# EAGLE schematic Adafruit Metro ESP32-P4 Hydra rev A (EAGLE 9.6.2)

## Sheet 1 of 2
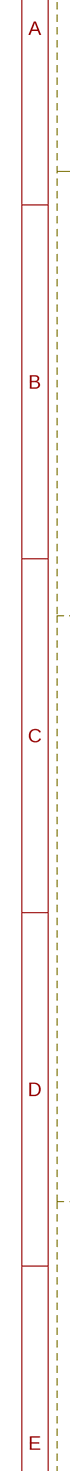
[diagram p0: schematic, sheet 1, part 1 of 2]
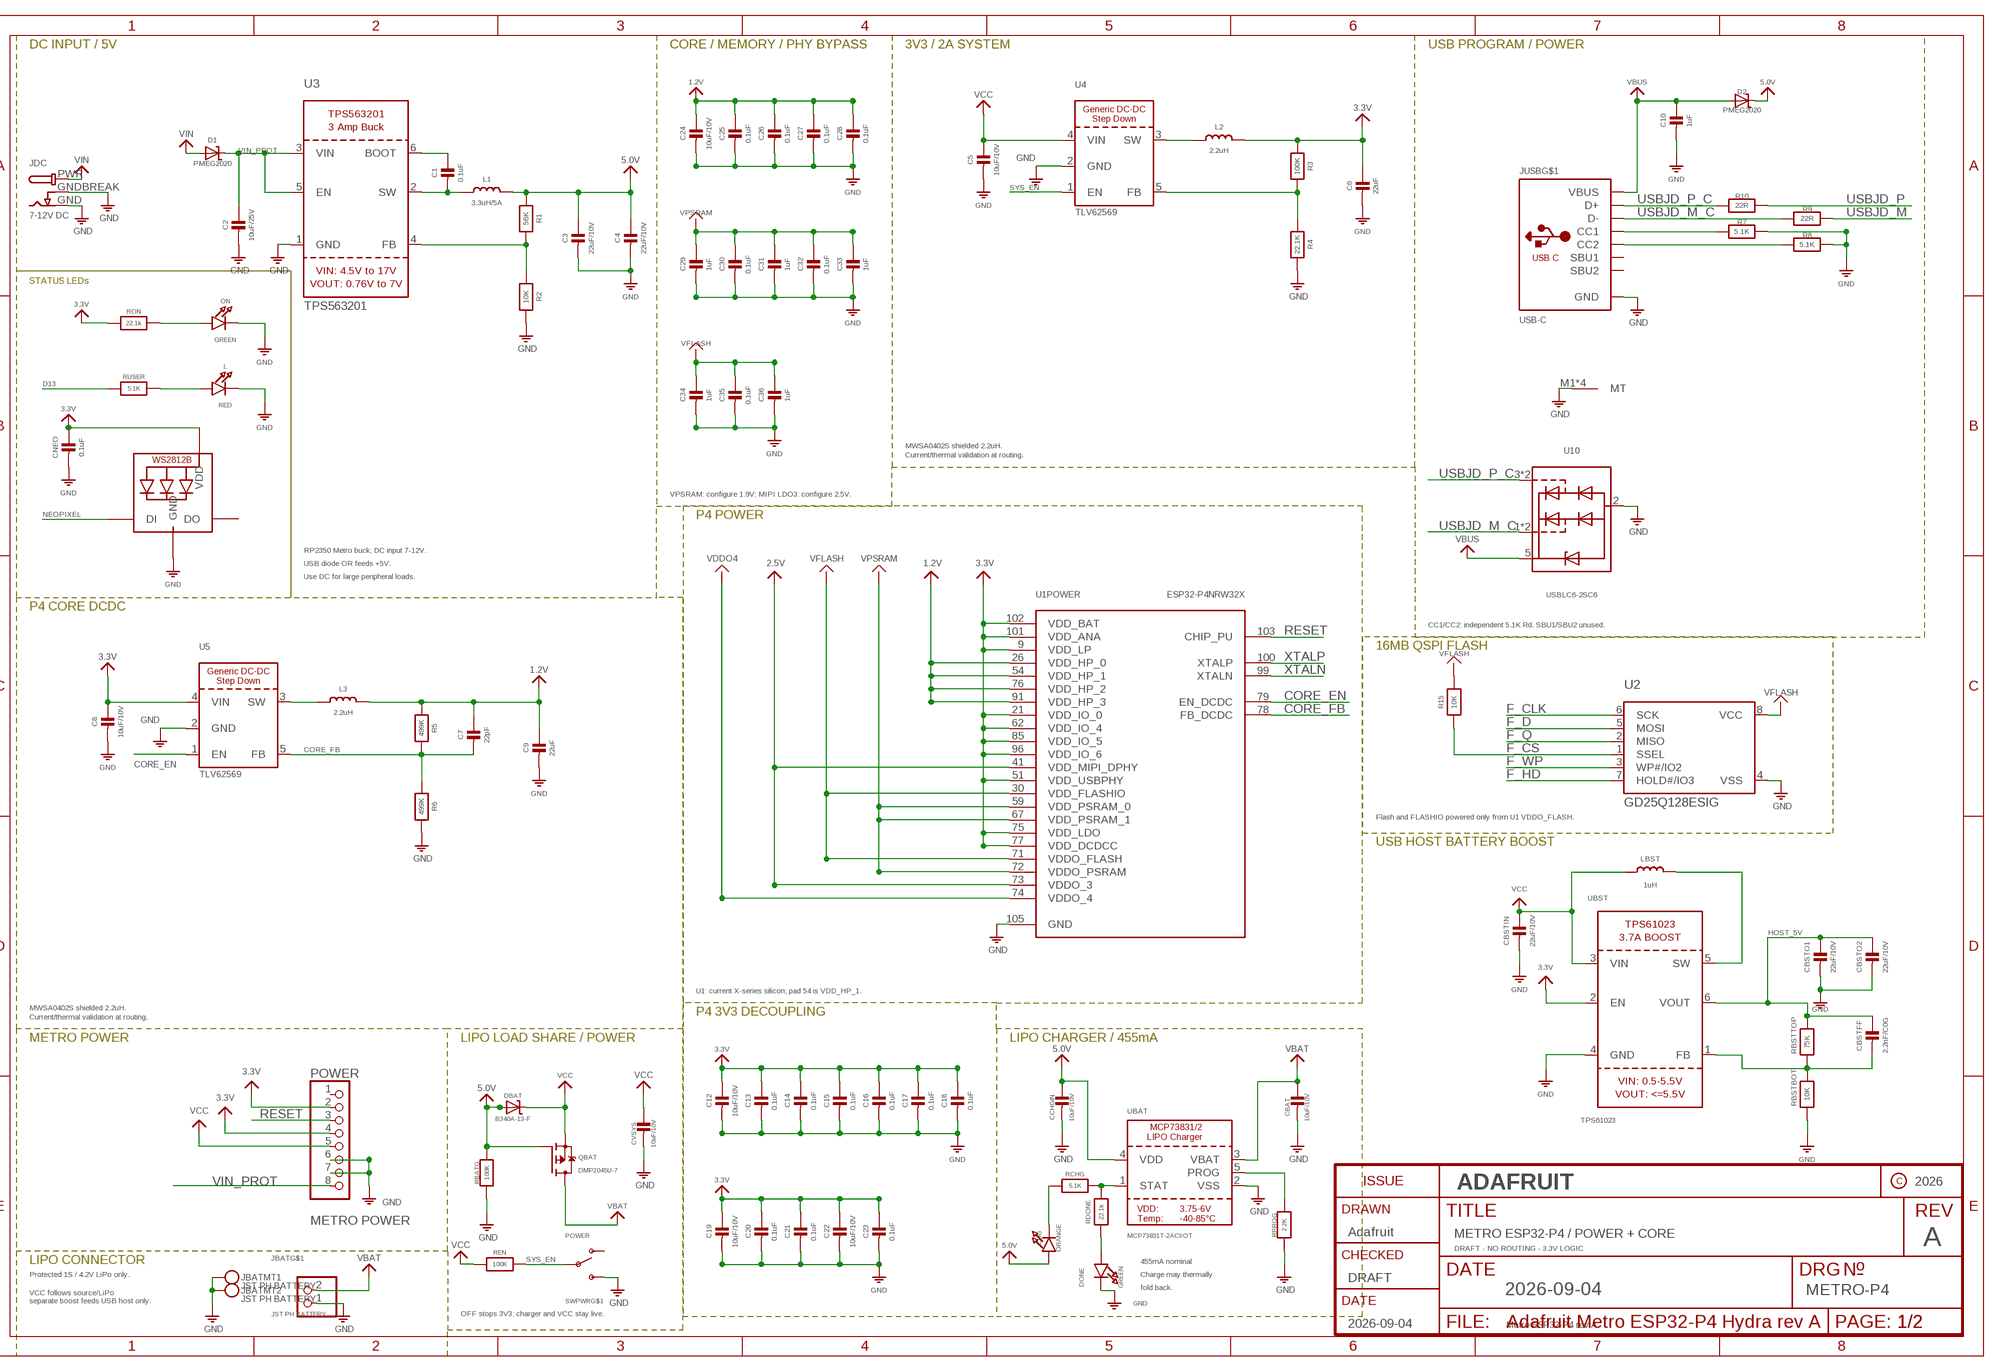
[diagram p1: schematic, sheet 1, part 2 of 2]
FRAME1 (FRAME_A3): CHECKED: DRAFT; COMPANY: ADAFRUIT; DATE: 2026-09-04; DRAWN: Adafruit; DRGNO: METRO-P4; REV: A; YEAR: 2026

### Parts
C1  0.1uF  CAP_CERAMIC_0402NO  [_0402NO]
C2  10uF/25V  CAP_CERAMIC0805-NOOUTLINE  [0805-NO]
C3  22uF/10V  CAP_CERAMIC0805-NOOUTLINE  [0805-NO]
C4  22uF/10V  CAP_CERAMIC0805-NOOUTLINE  [0805-NO]
C5  10uF/10V  CAP_CERAMIC0805-NOOUTLINE  [0805-NO]
C6  22uF  CAP_CERAMIC0805-NOOUTLINE  [0805-NO]
C7  22pF  CAP_CERAMIC_0402NO  [_0402NO]
C8  10uF/10V  CAP_CERAMIC0805-NOOUTLINE  [0805-NO]
C9  22uF  CAP_CERAMIC0805-NOOUTLINE  [0805-NO]
C10  1uF  CAP_CERAMIC0603_NO  [0603-NO]
C12  10uF/10V  CAP_CERAMIC0805-NOOUTLINE  [0805-NO]
C13  0.1uF  CAP_CERAMIC_0402NO  [_0402NO]
C14  0.1uF  CAP_CERAMIC_0402NO  [_0402NO]
C15  0.1uF  CAP_CERAMIC_0402NO  [_0402NO]
C16  0.1uF  CAP_CERAMIC_0402NO  [_0402NO]
C17  0.1uF  CAP_CERAMIC_0402NO  [_0402NO]
C18  0.1uF  CAP_CERAMIC_0402NO  [_0402NO]
C19  10uF/10V  CAP_CERAMIC0805-NOOUTLINE  [0805-NO]
C20  0.1uF  CAP_CERAMIC_0402NO  [_0402NO]
C21  0.1uF  CAP_CERAMIC_0402NO  [_0402NO]
C22  10uF/10V  CAP_CERAMIC0805-NOOUTLINE  [0805-NO]
C23  0.1uF  CAP_CERAMIC_0402NO  [_0402NO]
C24  10uF/10V  CAP_CERAMIC0805-NOOUTLINE  [0805-NO]
C25  0.1uF  CAP_CERAMIC_0402NO  [_0402NO]
C26  0.1uF  CAP_CERAMIC_0402NO  [_0402NO]
C27  0.1uF  CAP_CERAMIC_0402NO  [_0402NO]
C28  0.1uF  CAP_CERAMIC_0402NO  [_0402NO]
C29  1uF  CAP_CERAMIC0603_NO  [0603-NO]
C30  0.1uF  CAP_CERAMIC_0402NO  [_0402NO]
C31  1uF  CAP_CERAMIC0603_NO  [0603-NO]
C32  0.1uF  CAP_CERAMIC_0402NO  [_0402NO]
C33  1uF  CAP_CERAMIC0603_NO  [0603-NO]
C34  1uF  CAP_CERAMIC0603_NO  [0603-NO]
C35  0.1uF  CAP_CERAMIC_0402NO  [_0402NO]
C36  1uF  CAP_CERAMIC0603_NO  [0603-NO]
CBAT  10uF/10V  CAP_CERAMIC0805-NOOUTLINE  [0805-NO]
CBSTFF  2.2nF/C0G  CAP_CERAMIC_0402NO  [_0402NO]
CBSTIN  22uF/10V  CAP_CERAMIC0805-NOOUTLINE  [0805-NO]
CBSTO1  22uF/10V  CAP_CERAMIC0805-NOOUTLINE  [0805-NO]
CBSTO2  22uF/10V  CAP_CERAMIC0805-NOOUTLINE  [0805-NO]
CCHGIN  10uF/10V  CAP_CERAMIC0805-NOOUTLINE  [0805-NO]
CHG  ORANGE  LED0603_NOOUTLINE  [CHIPLED_0603_NOOUTLINE]
CNEO  0.1uF  CAP_CERAMIC_0402NO  [_0402NO]
CVSYS  10uF/10V  CAP_CERAMIC0805-NOOUTLINE  [0805-NO]
D1  PMEG2020  DIODE-SCHOTTKYSOD-323  [SOD-323]
D2  PMEG2020  DIODE-SCHOTTKYSOD-323  [SOD-323]
DBAT  B340A-13-F  DIODE-SCHOTTKYSMA  [SMADIODE]
DONE  GREEN  LED0603_NOOUTLINE  [CHIPLED_0603_NOOUTLINE]
HYDRA_ART  METRO-P4-HYDRA  [METRO-P4-HYDRA-68.58X53.34]
JBAT  JST PH BATTERY  CON_JST_PH_2PIN_MT_BATT  [JSTPH2_BATT]
JDC  7-12V DC  DCBARRELPTH  [DCJACK_2MM_PTH]
JUSB  USB-C  USB_C  [USB_C_CUSB31-CFM2AX-01-X]
L  RED  LED0603_NOOUTLINE  [CHIPLED_0603_NOOUTLINE]
L1  3.3uH/5A  INDUCTOR_0603S  [INDUCTOR_0603S]
L2  2.2uH  INDUCTORMWSA0402S  [INDUCTOR_SUNLORD_MWSA0402S]
L3  2.2uH  INDUCTORMWSA0402S  [INDUCTOR_SUNLORD_MWSA0402S]
LBST  1uH  INDUCTOR_5045_SMALLTABS  [INDUCTOR_5045_SMALLTABS]
LED1  WS2812B_3535FULL  [LED3535_FULLPADS]
ON  GREEN  LED0603_NOOUTLINE  [CHIPLED_0603_NOOUTLINE]
POWER  METRO POWER  HEADER-1X8OVALWAVE  [1X08_OVALWAVE]
QBAT  DMP2045U-7  MOSFET-P  [SOT23-R]
R1  56K  RESISTOR_0402NO  [_0402NO]
R2  10K  RESISTOR_0402NO  [_0402NO]
R3  100K  RESISTOR_0402NO  [_0402NO]
R4  22.1K  RESISTOR_0402NO  [_0402NO]
R5  499K  RESISTOR_0402NO  [_0402NO]
R6  499K  RESISTOR_0402NO  [_0402NO]
R7  5.1K  RESISTOR_0402NO  [_0402NO]
R8  5.1K  RESISTOR_0402NO  [_0402NO]
R9  22R  RESISTOR_0402NO  [_0402NO]
R10  22R  RESISTOR_0402NO  [_0402NO]
R15  10K  RESISTOR_0402NO  [_0402NO]
RBATG  100K  RESISTOR_0402NO  [_0402NO]
RBSTBOT  10K  RESISTOR_0402NO  [_0402NO]
RBSTTOP  75K  RESISTOR_0402NO  [_0402NO]
RCHG  5.1K  RESISTOR_0402NO  [_0402NO]
RDONE  22.1k  RESISTOR_0402NO  [_0402NO]
REN  100K  RESISTOR_0402NO  [_0402NO]
RON  22.1k  RESISTOR_0402NO  [_0402NO]
RPROG  2.2K  RESISTOR_0402NO  [_0402NO]
RUSER  5.1K  RESISTOR_0402NO  [_0402NO]
SWPWR  POWER  SWITCH_SPDT  [SPDT_SMT_SSSS811101]
U1  ESP32-P4NRW32X  ESP32-P4_NRW32X  [QFN104_10X10_P035_EP76]
U2  GD25Q128ESIG  SPIFLASH_8PIN208MIL  [SOIC8_208MIL]
U3  TPS563201  [SOT23-6]
U4  TLV62569  VREG_BUCK_5PIN_AP3429/A  [SOT23-5]
U5  TLV62569  VREG_BUCK_5PIN_AP3429/A  [SOT23-5]
U10  USBLC6-2SC6  ESDDIODEARRAY_USBLC6-2SC6  [SOT23_6L_ST]
UBAT  MCP73831T-2ACI/OT  MCP73831/2  [SOT23-5]
UBST  TPS61023  [SOT563]

### Nets
1.2V [FINEPOWER]: C7.1 C9.1 C24.1 C25.1 C26.1 C27.1 C28.1 L3.P$2 R5.1 U1.26(POWER:VDD_HP_0) U1.54(POWER:VDD_HP_1) U1.76(POWER:VDD_HP_2) U1.91(POWER:VDD_HP_3)
2.5V [FINEPOWER]: U1.41(POWER:VDD_MIPI_DPHY) U1.73(POWER:VDDO_3) ; also sheet 2
3.3V [FINEPOWER]: C6.1 C8.1 C12.1 C13.1 C14.1 C15.1 C16.1 C17.1 C18.1 C19.1 C20.1 C21.1 C22.1 C23.1 CNEO.1 L2.P$2 LED1.2(VDD) POWER.2 POWER.4 R3.1 RON.1 U1.9(POWER:VDD_LP) U1.21(POWER:VDD_IO_0) U1.51(POWER:VDD_USBPHY) U1.62(POWER:VDD_IO_4) U1.75(POWER:VDD_LDO) U1.77(POWER:VDD_DCDCC) U1.85(POWER:VDD_IO_5) U1.96(POWER:VDD_IO_6) U1.101(POWER:VDD_ANA) U1.102(POWER:VDD_BAT) U5.4(VIN) UBST.2(EN) ; also sheet 2
5.0V [HIGHPOWER]: C3.1 C4.1 CCHGIN.1 CHG.A D2.C DBAT.A L1.P$2 QBAT.1(G) R1.1 RBATG.1 UBAT.4(VDD)
BAT_LED: CHG.C RCHG.1
BAT_PROG: RPROG.1 UBAT.5(PROG)
BAT_STAT: RCHG.2 RDONE.1 UBAT.1(STAT)
BST_FB: CBSTFF.2 RBSTBOT.1 RBSTTOP.2 UBST.1(FB)
BST_SW [SWITCH]: LBST.2 UBST.5(SW)
BUCK5_BST: C1.1 U3.6(BOOT)
BUCK5_FB: R1.2 R2.1 U3.4(FB)
BUCK5_SW [SWITCH]: C1.2 L1.P$1 U3.2(SW)
CORE_EN: U1.79(POWER:EN_DCDC) U5.1(EN)
CORE_FB: C7.2 R5.2 R6.1 U1.78(POWER:FB_DCDC) U5.5(FB)
D13: RUSER.1 ; also sheet 2
DONE_LED: DONE.A RDONE.2
F_CLK: U2.6(SCK) ; also sheet 2
F_CS: R15.2 U2.1(SSEL) ; also sheet 2
F_D: U2.5(MOSI) ; also sheet 2
F_HD: U2.7(HOLD#/IO3) ; also sheet 2
F_Q: U2.2(MISO) ; also sheet 2
F_WP: U2.3(WP#/IO2) ; also sheet 2
GND [GROUND]: C2.2 C3.2 C4.2 C5.2 C6.2 C8.2 C9.2 C10.2 C12.2 C13.2 C14.2 C15.2 C16.2 C17.2 C18.2 C19.2 C20.2 C21.2 C22.2 C23.2 C24.2 C25.2 C26.2 C27.2 C28.2 C29.2 C30.2 C31.2 C32.2 C33.2 C34.2 C35.2 C36.2 CBAT.2 CBSTIN.2 CBSTO1.2 CBSTO2.2 CCHGIN.2 CNEO.2 CVSYS.2 DONE.C JBAT.1 JBAT.NC1 JBAT.NC2 JDC.GND JDC.GNDBREAK JUSB.A1B12(GND) JUSB.B1A12(GND) JUSB.M1(MT) JUSB.M2(MT) JUSB.M3(MT) JUSB.M4(MT) L.C LED1.4(GND) ON.C POWER.6 POWER.7 R2.2 R4.2 R6.2 R7.2 R8.2 RBATG.2 RBSTBOT.2 RPROG.2 SWPWR.C(S) U1.105(POWER:GND) U2.4(VSS) U3.1(GND) U4.2(GND) U5.2(GND) U10.2(GND) UBAT.2(VSS) UBST.4(GND) ; also sheet 2
HOST_5V [POWER]: CBSTFF.1 CBSTO1.1 CBSTO2.1 RBSTTOP.1 UBST.6(VOUT) ; also sheet 2
JUSBCC1: JUSB.A5(CC1) R7.1
JUSBCC2: JUSB.B5(CC2) R8.1
LED_ON: ON.A RON.2
LED_USER: L.A RUSER.2
NEOPIXEL: LED1.1(DI) ; also sheet 2
RESET: POWER.3 U1.103(POWER:CHIP_PU) ; also sheet 2
SYS_EN: REN.2 SWPWR.B(P) U4.1(EN)
U4_FB: R3.2 R4.1 U4.5(FB)
U4_SW [SWITCH]: L2.P$1 U4.3(SW)
U5_SW [SWITCH]: L3.P$1 U5.3(SW)
USBJD_M: R9.2 ; also sheet 2
USBJD_M_C: JUSB.A7(D-) JUSB.B7(D-) R9.1 U10.1(IO1) U10.6(IO1)
USBJD_P: R10.2 ; also sheet 2
USBJD_P_C: JUSB.A6(D+) JUSB.B6(D+) R10.1 U10.3(IO2) U10.4(IO2)
VBAT [HIGHPOWER]: CBAT.1 JBAT.2 QBAT.3(D) UBAT.3(VBAT) ; also sheet 2
VBUS [POWER]: C10.1 D2.A JUSB.A4B9(VBUS) JUSB.B4A9(VBUS) U10.5(VCC)
VCC [HIGHPOWER]: C5.1 CBSTIN.1 CVSYS.1 DBAT.C LBST.1 POWER.5 QBAT.2(S) REN.1 U4.4(VIN) UBST.3(VIN) ; also sheet 2
VDDO4 [FINEPOWER]: U1.74(POWER:VDDO_4) ; also sheet 2
VFLASH [FINEPOWER]: C34.1 C35.1 C36.1 R15.1 U1.30(POWER:VDD_FLASHIO) U1.71(POWER:VDDO_FLASH) U2.8(VCC)
VIN [HIGHPOWER]: D1.A JDC.PWR
VIN_PROT [HIGHPOWER]: C2.1 D1.C POWER.8 U3.3(VIN) U3.5(EN)
VPSRAM [FINEPOWER]: C29.1 C30.1 C31.1 C32.1 C33.1 U1.59(POWER:VDD_PSRAM_0) U1.67(POWER:VDD_PSRAM_1) U1.72(POWER:VDDO_PSRAM)
XTALN: U1.99(POWER:XTALN) ; also sheet 2
XTALP: U1.100(POWER:XTALP) ; also sheet 2
Unconnected: JUSB.A8(SBU1) JUSB.B8(SBU2) LED1.3(DO) POWER.1 SWPWR.A(O) SWPWR.SUP1(MT) SWPWR.SUP2(MT) SWPWR.SUP3(MT) SWPWR.SUP4(MT)

### Notes on the sheet
- DC INPUT / 5V | CORE / MEMORY / PHY BYPASS | 3V3 / 2A SYSTEM | USB PROGRAM / POWER
- STATUS LEDs
- MWSA0402S shielded 2.2uH.
- Current/thermal validation at routing.
- VPSRAM: configure 1.9V; MIPI LDO3: configure 2.5V.
- P4 POWER
- RP2350 Metro buck; DC input 7-12V.
- USB diode OR feeds +5V.
- Use DC for large peripheral loads.
- P4 CORE DCDC
- CC1/CC2: independent 5.1K Rd. SBU1/SBU2 unused.
- 16MB QSPI FLASH
- Flash and FLASHIO powered only from U1 VDDO_FLASH.
- USB HOST BATTERY BOOST
- U1: current X-series silicon; pad 54 is VDD_HP_1.
- MWSA0402S shielded 2.2uH.
- P4 3V3 DECOUPLING
- Current/thermal validation at routing.
- METRO POWER | LIPO LOAD SHARE / POWER | LIPO CHARGER / 455mA
- 2026
- ADAFRUIT
- Adafruit | METRO ESP32-P4 / POWER + CORE
- A
- DRAFT - NO ROUTING - 3.3V LOGIC
- LIPO CONNECTOR | 455mA nominal
- Protected 1S / 4.2V LiPo only. | Charge may thermally
- DRAFT
- fold back.
- 2026-09-04 | METRO-P4
- VCC follows source/LiPo
  separate boost feeds USB host only.
- OFF stops 3V3; charger and VCC stay live.
- 2026-09-04 | Metro ESP32-P4 rev A | 1/2

## Sheet 2 of 2
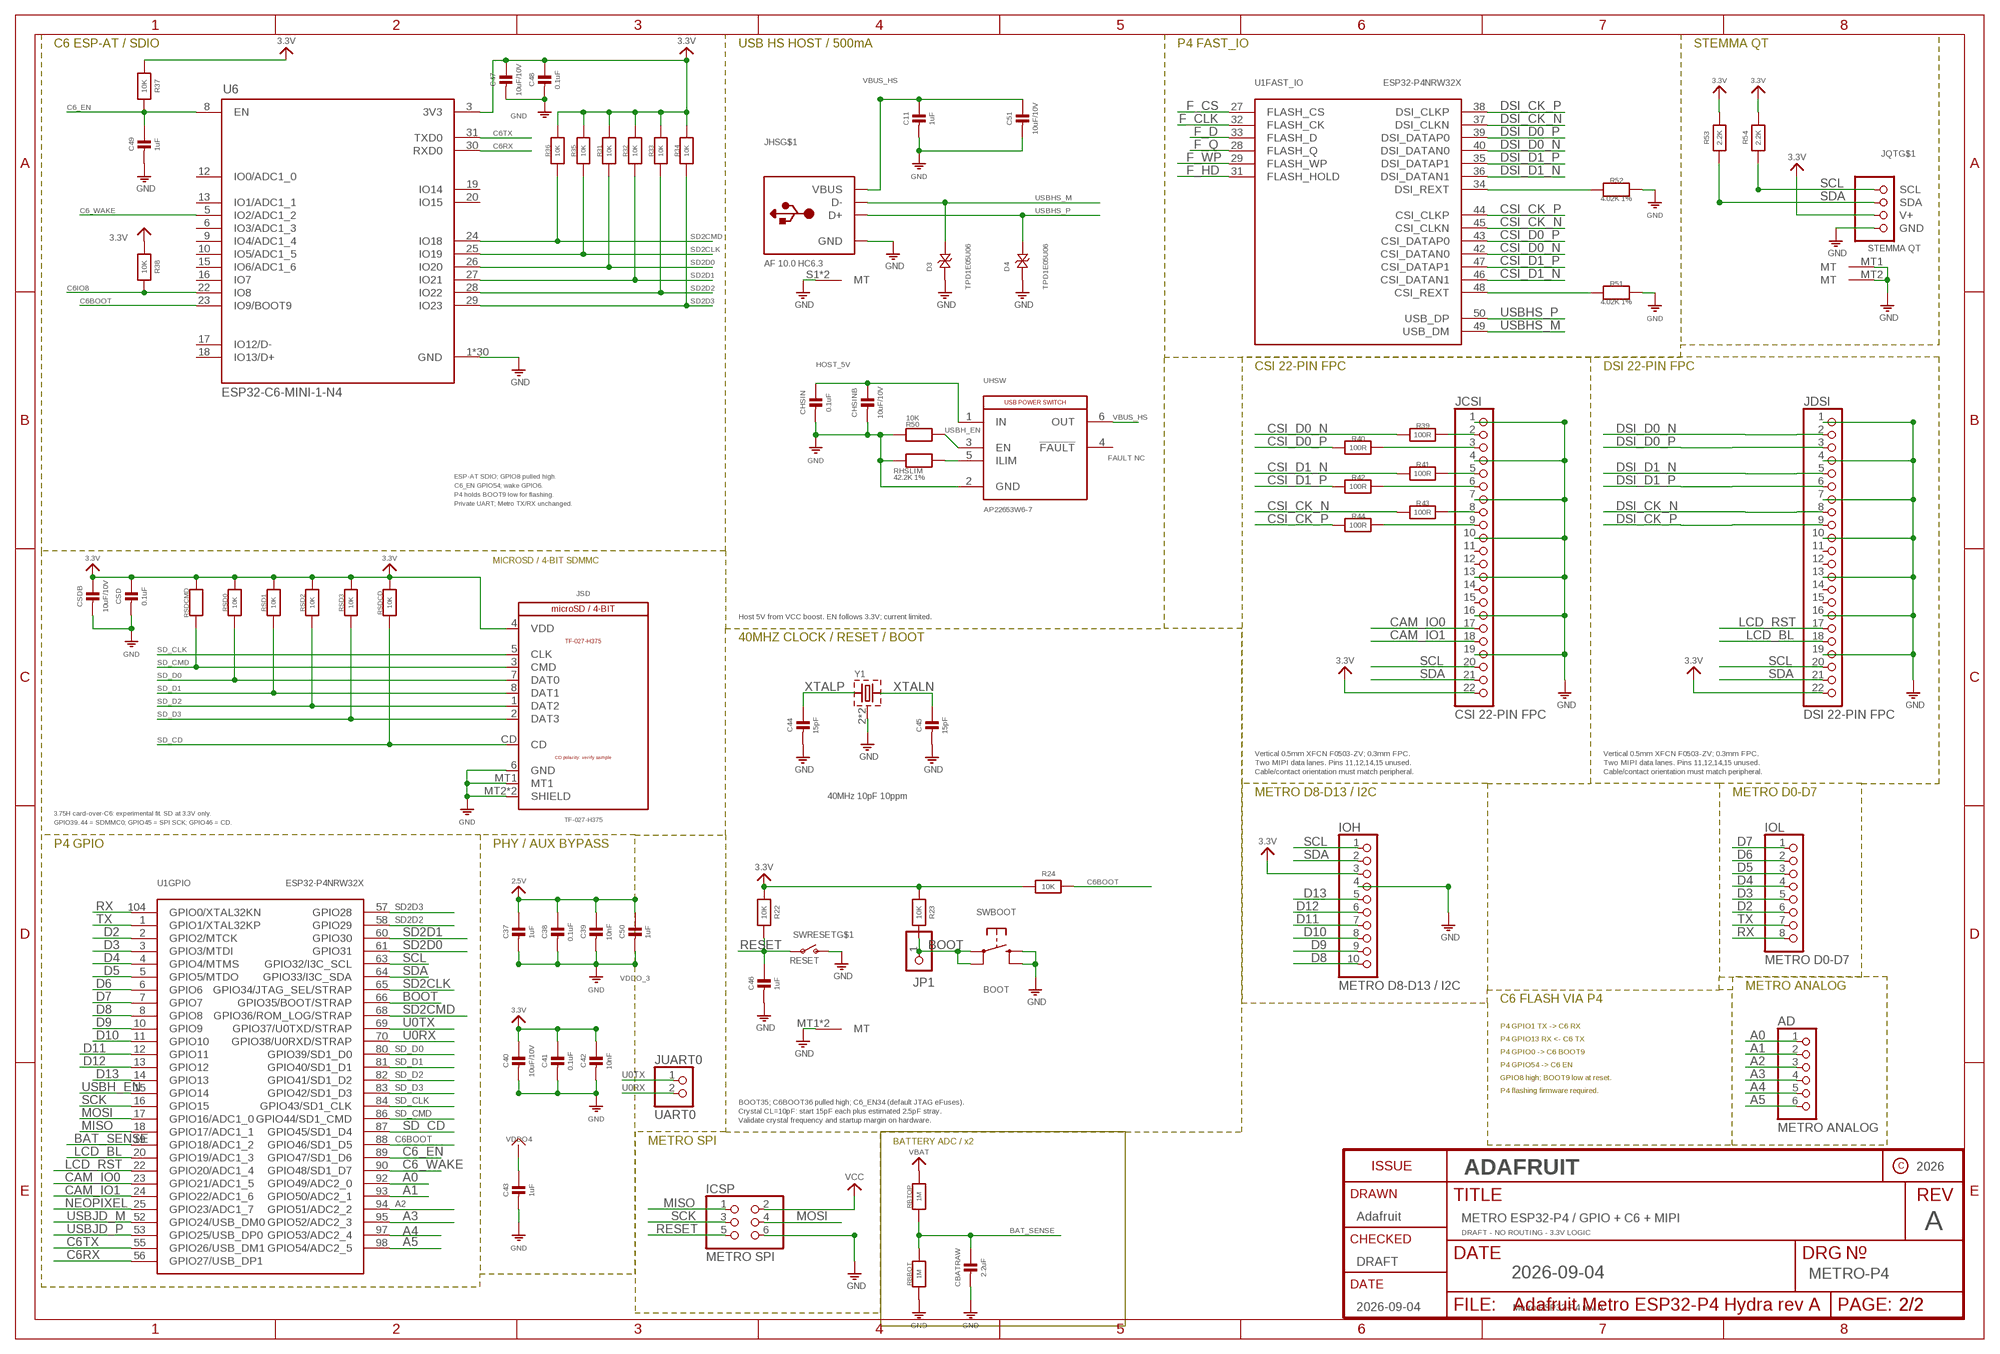
[diagram p2: schematic, sheet 2]

### Parts
AD  METRO ANALOG  HEADER-1X6OVALWAVE  [1X06_OVALWAVE]
C11  1uF  CAP_CERAMIC0603_NO  [0603-NO]
C37  1uF  CAP_CERAMIC0603_NO  [0603-NO]
C38  0.1uF  CAP_CERAMIC_0402NO  [_0402NO]
C39  10nF  CAP_CERAMIC_0402NO  [_0402NO]
C40  10uF/10V  CAP_CERAMIC0805-NOOUTLINE  [0805-NO]
C41  0.1uF  CAP_CERAMIC_0402NO  [_0402NO]
C42  10nF  CAP_CERAMIC_0402NO  [_0402NO]
C43  1uF  CAP_CERAMIC0603_NO  [0603-NO]
C44  15pF  CAP_CERAMIC_0402NO  [_0402NO]
C45  15pF  CAP_CERAMIC_0402NO  [_0402NO]
C46  1uF  CAP_CERAMIC0603_NO  [0603-NO]
C47  10uF/10V  CAP_CERAMIC0805-NOOUTLINE  [0805-NO]
C48  0.1uF  CAP_CERAMIC_0402NO  [_0402NO]
C49  1uF  CAP_CERAMIC0603_NO  [0603-NO]
C50  1uF  CAP_CERAMIC0603_NO  [0603-NO]
C51  10uF/10V  CAP_CERAMIC0805-NOOUTLINE  [0805-NO]
CBATRAW  2.2uF  CAP_CERAMIC0805-NOOUTLINE  [0805-NO]
CHSIN  0.1uF  CAP_CERAMIC_0402NO  [_0402NO]
CHSINB  10uF/10V  CAP_CERAMIC0805-NOOUTLINE  [0805-NO]
CSD  0.1uF  CAP_CERAMIC_0402NO  [_0402NO]
CSDB  10uF/10V  CAP_CERAMIC0805-NOOUTLINE  [0805-NO]
D3  TPD1E05U06  TVS_SOD523  [SOD-523]
D4  TPD1E05U06  TVS_SOD523  [SOD-523]
ICSP  METRO SPI  HEADER-2X3  [2X03_ROUND_70MIL]
IOH  METRO D8-D13 / I2C  HEADER-1X10OVALWAVE  [1X10_OVALWAVE]
IOL  METRO D0-D7  HEADER-1X8OVALWAVE  [1X08_OVALWAVE]
JCSI  CSI 22-PIN FPC  HEADER-1X22_22PIN_0.5MM_VERT_XFCN  [FPC_22PIN_0.5MM_VERT_F0503_ZV]
JDSI  DSI 22-PIN FPC  HEADER-1X22_22PIN_0.5MM_VERT_XFCN  [FPC_22PIN_0.5MM_VERT_F0503_ZV]
JHS  AF 10.0 HC6.3  USB_TYPEA_THMSHORT  [USB_TYPE_A_THM_SHORT]
JP1  HEADER-1X1ROUND  [1X01_ROUND]
JQT  STEMMA QT  STEMMA_I2C_QT  [JST_SH4]
JSD  TF-027-H375  HANBO_TF_027_H375  [HANBO_TF_027_H375]
JUART0  UART0  HEADER-1X2ROUND  [1X02_ROUND]
R22  10K  RESISTOR_0402NO  [_0402NO]
R23  10K  RESISTOR_0402NO  [_0402NO]
R24  10K  RESISTOR_0402NO  [_0402NO]
R31  10K  RESISTOR_0402NO  [_0402NO]
R32  10K  RESISTOR_0402NO  [_0402NO]
R33  10K  RESISTOR_0402NO  [_0402NO]
R34  10K  RESISTOR_0402NO  [_0402NO]
R35  10K  RESISTOR_0402NO  [_0402NO]
R36  10K  RESISTOR_0402NO  [_0402NO]
R37  10K  RESISTOR_0402NO  [_0402NO]
R38  10K  RESISTOR_0402NO  [_0402NO]
R39  100R  RESISTOR_0402NO  [_0402NO]
R40  100R  RESISTOR_0402NO  [_0402NO]
R41  100R  RESISTOR_0402NO  [_0402NO]
R42  100R  RESISTOR_0402NO  [_0402NO]
R43  100R  RESISTOR_0402NO  [_0402NO]
R44  100R  RESISTOR_0402NO  [_0402NO]
R50  10K  RESISTOR_0402NO  [_0402NO]
R51  4.02K 1%  RESISTOR_0402NO  [_0402NO]
R52  4.02K 1%  RESISTOR_0402NO  [_0402NO]
R53  2.2K  RESISTOR_0402NO  [_0402NO]
R54  2.2K  RESISTOR_0402NO  [_0402NO]
RBBOT  1M  RESISTOR_0402NO  [_0402NO]
RBTOP  1M  RESISTOR_0402NO  [_0402NO]
RHSLIM  42.2K 1%  RESISTOR_0402NO  [_0402NO]
RSD0  10K  RESISTOR_0402NO  [_0402NO]
RSD1  10K  RESISTOR_0402NO  [_0402NO]
RSD2  10K  RESISTOR_0402NO  [_0402NO]
RSD3  10K  RESISTOR_0402NO  [_0402NO]
RSDCD  10K  RESISTOR_0402NO  [_0402NO]
RSDCMD  10K  RESISTOR_0402NO  [_0402NO]
SWBOOT  BOOT  SWITCH_TACT_SMT_RKB2  [BTN_RKB2_4.6X2.8]
SWRESET  RESET  SWITCH_SPST_MNT_TACT_RA  [SPST_TACTILE_RA]
U6  ESP32-C6-MINI-1-N4  ESP32-C6-MINI_MINI  [ESP32-PICO-MINI]
UHSW  AP22653W6-7  AP22653_W6-7  [SOT26_TYPE_A1_DIODES]
Y1  40MHz 10pF 10ppm  CRYSTAL_GND2.0X1.6  [CRYSTAL_2X1.6]

### Nets
2.5V [FINEPOWER]: C37.1 C38.1 C39.1 C50.1 ; also sheet 1
3.3V [FINEPOWER]: C40.1 C41.1 C42.1 C47.1 C48.1 CSD.1 CSDB.1 IOH.3 JCSI.22 JDSI.22 JQT.2(V+) JSD.4(VDD) R22.1 R23.1 R24.1 R31.1 R32.1 R33.1 R34.1 R35.1 R36.1 R37.1 R38.1 R53.1 R54.1 RSD0.1 RSD1.1 RSD2.1 RSD3.1 RSDCD.1 RSDCMD.1 U6.3(3V3) ; also sheet 1
A0: AD.1 U1.92(GPIO:GPIO49/ADC2_0)
A1: AD.2 U1.93(GPIO:GPIO50/ADC2_1)
A2: AD.3 U1.94(GPIO:GPIO51/ADC2_2)
A3: AD.4 U1.95(GPIO:GPIO52/ADC2_3)
A4: AD.5 U1.97(GPIO:GPIO53/ADC2_4)
A5: AD.6 U1.98(GPIO:GPIO54/ADC2_5)
BAT_SENSE: CBATRAW.1 RBBOT.1 RBTOP.2 U1.19(GPIO:GPIO18/ADC1_2)
BOOT: JP1.1 R23.2 SWBOOT.A'(P1) SWBOOT.A(P) U1.66(GPIO:GPIO35/BOOT/STRAP)
C6_EN: C49.1 R37.2 U1.89(GPIO:GPIO47/SD1_D6) U6.8(EN)
C6_WAKE: U1.90(GPIO:GPIO48/SD1_D7) U6.5(IO2/ADC1_2)
C6BOOT: R24.2 U1.88(GPIO:GPIO46/SD1_D5) U6.23(IO9/BOOT9)
C6IO8: R38.2 U6.22(IO8)
C6RX: U1.56(GPIO:GPIO27/USB_DP1) U6.30(RXD0)
C6TX: U1.55(GPIO:GPIO26/USB_DM1) U6.31(TXD0)
CAM_IO0: JCSI.17 U1.23(GPIO:GPIO21/ADC1_5)
CAM_IO1: JCSI.18 U1.24(GPIO:GPIO22/ADC1_6)
CSI_CK_C_N: JCSI.8 R43.2
CSI_CK_C_P: JCSI.9 R44.2
CSI_CK_N: R43.1 U1.45(FAST_IO:CSI_CLKN)
CSI_CK_P: R44.1 U1.44(FAST_IO:CSI_CLKP)
CSI_D0_C_N: JCSI.2 R39.2
CSI_D0_C_P: JCSI.3 R40.2
CSI_D0_N: R39.1 U1.42(FAST_IO:CSI_DATAN0)
CSI_D0_P: R40.1 U1.43(FAST_IO:CSI_DATAP0)
CSI_D1_C_N: JCSI.5 R41.2
CSI_D1_C_P: JCSI.6 R42.2
CSI_D1_N: R41.1 U1.46(FAST_IO:CSI_DATAN1)
CSI_D1_P: R42.1 U1.47(FAST_IO:CSI_DATAP1)
CSI_EXT: R51.1 U1.48(FAST_IO:CSI_REXT)
D2: IOL.6 U1.2(GPIO:GPIO2/MTCK)
D3: IOL.5 U1.3(GPIO:GPIO3/MTDI)
D4: IOL.4 U1.4(GPIO:GPIO4/MTMS)
D5: IOL.3 U1.5(GPIO:GPIO5/MTDO)
D6: IOL.2 U1.6(GPIO:GPIO6)
D7: IOL.1 U1.7(GPIO:GPIO7)
D8: IOH.10 U1.8(GPIO:GPIO8)
D9: IOH.9 U1.10(GPIO:GPIO9)
D10: IOH.8 U1.11(GPIO:GPIO10)
D11: IOH.7 U1.12(GPIO:GPIO11)
D12: IOH.6 U1.13(GPIO:GPIO12)
D13: IOH.5 U1.14(GPIO:GPIO13) ; also sheet 1
DSI_CK_N: JDSI.8 U1.37(FAST_IO:DSI_CLKN)
DSI_CK_P: JDSI.9 U1.38(FAST_IO:DSI_CLKP)
DSI_D0_N: JDSI.2 U1.40(FAST_IO:DSI_DATAN0)
DSI_D0_P: JDSI.3 U1.39(FAST_IO:DSI_DATAP0)
DSI_D1_N: JDSI.5 U1.36(FAST_IO:DSI_DATAN1)
DSI_D1_P: JDSI.6 U1.35(FAST_IO:DSI_DATAP1)
DSI_EXT: R52.1 U1.34(FAST_IO:DSI_REXT)
F_CLK: U1.32(FAST_IO:FLASH_CK) ; also sheet 1
F_CS: U1.27(FAST_IO:FLASH_CS) ; also sheet 1
F_D: U1.33(FAST_IO:FLASH_D) ; also sheet 1
F_HD: U1.31(FAST_IO:FLASH_HOLD) ; also sheet 1
F_Q: U1.28(FAST_IO:FLASH_Q) ; also sheet 1
F_WP: U1.29(FAST_IO:FLASH_WP) ; also sheet 1
GND [GROUND]: C11.2 C37.2 C38.2 C39.2 C40.2 C41.2 C42.2 C43.2 C44.2 C45.2 C46.2 C47.2 C48.2 C49.2 C50.2 C51.2 CBATRAW.2 CHSIN.2 CHSINB.2 CSD.2 CSDB.2 D3.A D4.A ICSP.6 IOH.4 JCSI.1 JCSI.4 JCSI.7 JCSI.10 JCSI.13 JCSI.16 JCSI.19 JDSI.1 JDSI.4 JDSI.7 JDSI.10 JDSI.13 JDSI.16 JDSI.19 JHS.GND JHS.S1(MT) JHS.S2(MT) JQT.1(GND) JQT.MT1(MT) JQT.MT2(MT) JSD.6(GND) JSD.MT1 JSD.MT2(SHIELD) JSD.MT3(SHIELD) R50.2 R51.2 R52.2 RBBOT.2 RHSLIM.1 SWBOOT.B'(S1) SWBOOT.B(S) SWRESET.2(S) SWRESET.MT1(MT) SWRESET.MT2(MT) U6.1(GND) U6.2(GND) U6.11(GND) U6.14(GND) U6.36(GND) U6.37(GND) U6.38(GND) U6.39(GND) U6.40(GND) U6.41(GND) U6.42(GND) U6.43(GND) U6.44(GND) U6.45(GND) U6.46(GND) U6.47(GND) U6.48(GND) U6.49(GND) U6.50(GND) U6.51(GND) U6.52(GND) U6.53(GND) U6.54(GND) U6.55(GND) U6.56(GND) U6.57(GND) U6.58(GND) U6.59(GND) U6.60(GND) U6.61(GND) UHSW.2(GND) Y1.2(GND) Y1.4(GND) ; also sheet 1
HOST_5V [POWER]: CHSIN.1 CHSINB.1 UHSW.1(IN) ; also sheet 1
HOST_ILIM: RHSLIM.2 UHSW.5(ILIM)
LCD_BL: JDSI.18 U1.20(GPIO:GPIO19/ADC1_3)
LCD_RST: JDSI.17 U1.22(GPIO:GPIO20/ADC1_4)
MISO: ICSP.1 U1.18(GPIO:GPIO17/ADC1_1)
MOSI: ICSP.4 U1.17(GPIO:GPIO16/ADC1_0)
NEOPIXEL: U1.25(GPIO:GPIO23/ADC1_7) ; also sheet 1
RESET: C46.1 ICSP.5 R22.2 SWRESET.1(P) ; also sheet 1
RX: IOL.8 U1.104(GPIO:GPIO0/XTAL32KN)
SCK: ICSP.3 U1.16(GPIO:GPIO15)
SCL: IOH.1 JCSI.20 JDSI.20 JQT.4(SCL) R54.2 U1.63(GPIO:GPIO32/I3C_SCL)
SD2CLK: R35.2 U1.65(GPIO:GPIO34/JTAG_SEL/STRAP) U6.25(IO19)
SD2CMD: R36.2 U1.68(GPIO:GPIO36/ROM_LOG/STRAP) U6.24(IO18)
SD2D0: R31.2 U1.61(GPIO:GPIO31) U6.26(IO20)
SD2D1: R32.2 U1.60(GPIO:GPIO30) U6.27(IO21)
SD2D2: R33.2 U1.58(GPIO:GPIO29) U6.28(IO22)
SD2D3: R34.2 U1.57(GPIO:GPIO28) U6.29(IO23)
SD_CD: JSD.CD RSDCD.2 U1.87(GPIO:GPIO45/SD1_D4)
SD_CLK: JSD.5(CLK) U1.84(GPIO:GPIO43/SD1_CLK)
SD_CMD: JSD.3(CMD) RSDCMD.2 U1.86(GPIO:GPIO44/SD1_CMD)
SD_D0: JSD.7(DAT0) RSD0.2 U1.80(GPIO:GPIO39/SD1_D0)
SD_D1: JSD.8(DAT1) RSD1.2 U1.81(GPIO:GPIO40/SD1_D1)
SD_D2: JSD.1(DAT2) RSD2.2 U1.82(GPIO:GPIO41/SD1_D2)
SD_D3: JSD.2(DAT3) RSD3.2 U1.83(GPIO:GPIO42/SD1_D3)
SDA: IOH.2 JCSI.21 JDSI.21 JQT.3(SDA) R53.2 U1.64(GPIO:GPIO33/I3C_SDA)
TX: IOL.7 U1.1(GPIO:GPIO1/XTAL32KP)
U0RX: JUART0.2 U1.70(GPIO:GPIO38/U0RXD/STRAP)
U0TX: JUART0.1 U1.69(GPIO:GPIO37/U0TXD/STRAP)
USBH_EN: R50.1 U1.15(GPIO:GPIO14) UHSW.3(EN)
USBHS_M: D3.K(C) JHS.D- U1.49(FAST_IO:USB_DM)
USBHS_P: D4.K(C) JHS.D+ U1.50(FAST_IO:USB_DP)
USBJD_M: U1.52(GPIO:GPIO24/USB_DM0) ; also sheet 1
USBJD_P: U1.53(GPIO:GPIO25/USB_DP0) ; also sheet 1
VBAT [HIGHPOWER]: RBTOP.1 ; also sheet 1
VBUS_HS [POWER]: C11.1 C51.1 JHS.VBUS UHSW.6(OUT)
VCC [HIGHPOWER]: ICSP.2 ; also sheet 1
VDDO4 [FINEPOWER]: C43.1 ; also sheet 1
XTALN: C45.1 Y1.3 ; also sheet 1
XTALP: C44.1 Y1.1 ; also sheet 1
Unconnected: JCSI.11 JCSI.12 JCSI.14 JCSI.15 JDSI.11 JDSI.12 JDSI.14 JDSI.15 U6.6(IO3/ADC1_3) U6.9(IO4/ADC1_4) U6.10(IO5/ADC1_5) U6.12(IO0/ADC1_0) U6.13(IO1/ADC1_1) U6.15(IO6/ADC1_6) U6.16(IO7) U6.17(IO12/D-) U6.18(IO13/D+) U6.19(IO14) U6.20(IO15) UHSW.4(!FAULT)

### Notes on the sheet
- C6 ESP-AT / SDIO | USB HS HOST / 500mA | P4 FAST_IO | STEMMA QT
- CSI 22-PIN FPC | DSI 22-PIN FPC
- FAULT NC
- ESP-AT SDIO; GPIO8 pulled high.
- C6_EN GPIO54; wake GPIO6.
- P4 holds BOOT9 low for flashing.
- Private UART; Metro TX/RX unchanged.
- MICROSD / 4-BIT SDMMC
- Host 5V from VCC boost. EN follows 3.3V; current limited.
- 40MHZ CLOCK / RESET / BOOT
- Vertical 0.5mm XFCN F0503-ZV; 0.3mm FPC. | Vertical 0.5mm XFCN F0503-ZV; 0.3mm FPC.
- Two MIPI data lanes. Pins 11,12,14,15 unused. | Two MIPI data lanes. Pins 11,12,14,15 unused.
- Cable/contact orientation must match peripheral. | Cable/contact orientation must match peripheral.
- METRO D8-D13 / I2C | METRO D0-D7
- 3.75H card-over-C6: experimental fit. SD at 3.3V only.
- GPIO39..44 = SDMMC0; GPIO45 = SPI SCK; GPIO46 = CD.
- P4 GPIO | PHY / AUX BYPASS
- VDDO_3
- METRO ANALOG
- C6 FLASH VIA P4
- P4 GPIO1 TX -> C6 RX
- P4 GPIO13 RX <- C6 TX
- P4 GPIO0 -> C6 BOOT9
- P4 GPIO54 -> C6 EN
- GPIO8 high; BOOT9 low at reset.
- P4 flashing firmware required.
- BOOT35; C6BOOT36 pulled high; C6_EN34 (default JTAG eFuses).
- Crystal CL=10pF: start 15pF each plus estimated 2.5pF stray.
- Validate crystal frequency and startup margin on hardware.
- METRO SPI | BATTERY ADC / x2
- 2026
- ADAFRUIT
- Adafruit | METRO ESP32-P4 / GPIO + C6 + MIPI
- A
- DRAFT - NO ROUTING - 3.3V LOGIC
- DRAFT
- 2026-09-04 | METRO-P4
- 2026-09-04 | Metro ESP32-P4 rev A | 2/2

## Library data of the parts
AD = microbuilder:HEADER-1X6: PIN HEADER; FORCETHM: 1
C1-C51 CBAT CBATRAW CCHGIN CHSIN CHSINB CNEO CSD CSDB CVSYS = microbuilder:CAP_CERAMIC: Ceramic Capacitors For new designs, use the packages preceded by an '_' character since they are more reliable: The following footprints should be used on most boards: _0402 - Standard footprint for regular board layouts _0603 - Standard footprint for regular board layouts _0805 - Standard footprint for regular board layouts _1206 - Standard footprint for regular board layouts For extremely tight-pitch boards where space is at a premium, the following 'micro-pitch' footprints can be used (smaller pads, no silkscreen outline, etc.): _0402MP - Micro-pitch footprint for very dense/compact boards _0603MP - Micro-pitch footprint for very dense/compact boards _0805MP - Micro-pitch footprint for very dense/compact boards _1206MP - Micro-pitch footprint for very dense/compact boards
CBSTFF = microbuilder:CAP_CERAMIC: Ceramic Capacitors For new designs, use the packages preceded by an '_' character since they are more reliable: The following footprints should be used on most boards: _0402 - Standard footprint for regular board layouts _0603 - Standard footprint for regular board layouts _0805 - Standard footprint for regular board layouts _1206 - Standard footprint for regular board layouts For extremely tight-pitch boards where space is at a premium, the following 'micro-pitch' footprints can be used (smaller pads, no silkscreen outline, etc.): _0402MP - Micro-pitch footprint for very dense/compact boards _0603MP - Micro-pitch footprint for very dense/compact boards _0805MP - Micro-pitch footprint for very dense/compact boards _1206MP - Micro-pitch footprint for very dense/compact boards; DIELECTRIC: C0G; LCSC: C2987940; MPN: GRM1555C1H222GA01D
CBSTIN CBSTO1 CBSTO2 = microbuilder:CAP_CERAMIC: Ceramic Capacitors For new designs, use the packages preceded by an '_' character since they are more reliable: The following footprints should be used on most boards: _0402 - Standard footprint for regular board layouts _0603 - Standard footprint for regular board layouts _0805 - Standard footprint for regular board layouts _1206 - Standard footprint for regular board layouts For extremely tight-pitch boards where space is at a premium, the following 'micro-pitch' footprints can be used (smaller pads, no silkscreen outline, etc.): _0402MP - Micro-pitch footprint for very dense/compact boards _0603MP - Micro-pitch footprint for very dense/compact boards _0805MP - Micro-pitch footprint for very dense/compact boards _1206MP - Micro-pitch footprint for very dense/compact boards; DIELECTRIC: X5R; LCSC: C29277; MPN: CL21A226MPQNNNE
CHG DONE L ON = microbuilder:LED: LED 0603 - 0603 Surface Mount Package 2mA: Green LED - Low Power (3.9mcd, 2ma, 1.7Vf) - Digikey: 475-2709-2-ND Orange LED - Low Power (9.8mcd, 2ma, 1.8Vf) - Digikey: 475-1194-2-ND Red LED - Low Power (5mcd, 2ma, 1.8Vf) - Digikey: 475-1195-2-ND Yellow LED - Low Power (7mcd, 2ma, 1.8Vf) - Digikey: 475-1196-2-ND 5mA: Blue LED - Low Power (17mcd, 5ma, 2.9Vf) - Digikey: LNJ937W8CRACT-ND 0805 - 0805 Surface Mount Package 2mA: Red LED (8.8mcd, 2mA, 1.8Vf, Clear) - Low Power [Digikey: 475-2510-1-ND] Green LED (5mcd, 2mA, 1.8Vf, Clear) - Low Power [Digikey: 475-2730-1-ND] Yellow LED (11.3mcd, 2mA, 1.8Vf, Clear) - Low Power [Digikey: 475-2555-1-ND] 20mA: Red LED (104mcd, 20mA, Diffused) - LS R976 [Digikey: 475-1278-6-ND] Red LED (12mcd, 20mA, 2.0Vf, Clear) - APT2012EC [Digikey: 754-1128-1-ND] Green LED (15mcd, 20mA, 2.2Vf, Clear) - APT2012GC [Digikey: 754-1131-1-ND] Orange LED (160mcd, 20mA, 2.1Vf, Clear) - APT2012SECK [Digikey: 754-1130-1-ND] 1206 - 1206 Surface Mount Package Green LED (26mcd, 20mA, Diffused) - LG N971 [Digikey: 475-1407-6-ND] Red LED (15mcd, 20mA, Diffused) - LH N974 [Digikey: 475-1416-6-ND] Cree - Cree High-Power Surface Mount LEDs XPEBWT-L1-0000-00D50 - White 111lm 350mA 2.9Vf 6200K 110° XTEAWT-00-0000-00000LEE3 - White 114lm 350mA 2.85Vf 5000K 115° Everlight - Everlight 45-21 Series Surface Mount LEDs 45-21/QK2C-B2832AC2CB2/2T - Warm White 2000mcd 20mA 3.25Vf 3050K 120° 45-21/LK2C-B38452C4CB2/2T - Nuetral White 2000mcd 20mA 3.25Vf 4150K 120° 45-21/LK2C-B50634C6CB2/2T - Cold White 2200mcd 20mA 3.25Vf 5650K 120° PLCC2 Reverse Mount LS T77K-J1L2-1-0-2-R18-Z - Red 11.25mcd 2mA 1.8Vf 630nm 120° LO T77K-L1M2-24-Z - Orange 19.6mcd 2mA 1.8Vf 606nm 120° LY T77K-K2M1-26-Z - Yellow 15.7mcd 2mA 1.8Vf 587nm 120°; ROT: 270
D1 D2 = microbuilder:DIODE-SCHOTTKY
D3 D4 = adafruit_power:TVS; C_TYP: 0.42pF; DATASHEET: https://www.ti.com/lit/ds/symlink/tpd1e05u06.pdf; MPN: TPD1E05U06DYAR; PIN_MAP: C/K = pin1 IO; A = pin2 GND
DBAT = microbuilder:DIODE-SCHOTTKY; MANUFACTURER: Diodes Incorporated; MPN: B340A-13-F; THERMAL: Copper and full system-load validation required
HYDRA_ART = adafruit_silkscreen:METRO-P4-HYDRA
ICSP = microbuilder:HEADER-2X3: PIN HEADER; FORCETHM: 1
IOH = microbuilder:HEADER-1X10: PIN HEADER; FORCETHM: 1
IOL POWER = microbuilder:HEADER-1X8: PIN HEADER; FORCETHM: 1
JBAT = adafruit_electromech:CON_JST_PH_2PIN_MT; LCSC: C2764211; SOURCING: PENDING: S3 JST PH-compatible; no JLC alternate approved
JCSI JDSI = adafruit_electromech:HEADER-1X22; LCSC: C481245; MPN: F0503-ZV-22-20T-R
JDC = adafruit_electromech:DCBARREL: DC Barrel Jack DCJACK_1.3MM_PTH - Through Hole 1.3mm Jack (4UConnector: 05536) DCJACK_2MM_PTH - Through Hole 2.0/2.1 Jack (4UConnector: 05537) DCJACK_2MM_SMT - SMT 2.0/2.1mm Jack(4UConnector: 03267); FORCETHM: 1
JHS = adafruit_electromech:USB_TYPEA: USB - Type A Connectors Male types stick out and are inserted into a PC or matching females parts (these are the connectors used on USB Memory Sticks, etc.). Female parts are generally used for USB Host and accept a male-type connector. SMT - 4UCON: 10017 PTHFML - Digikey: 609-1045-ND, 4UCon: 05241 PTHFML-SLOT - generic PTH host with 0.90 x 3.00 mm plated shell slots on 13.14 mm centers PCB - Use 2.0mm thick PCBs with this footprint; FORCETHM: 1; LCSC: C456017; MPN: AF 10.0 HC6.3
JP1 = microbuilder:HEADER-1X1: PIN HEADER
JQT = adafruit_electromech:STEMMA_I2C; LCSC: C2905006
JSD = microbuilder:HANBO_TF_027: HANBO short microSD socket; 4-bit pinout. Exact TF-027-H375 / C22374618. Eight SD contacts, CD, separate upper-left metal/common MT1, and paired shell MT2/MT3. Ground metal feet externally; manufacturer does not specify detect contact truth table. Height is overall, NOT underside clearance.; DATASHEET: https://www.hanbodianzi.com/uploads/files/20230809/36ecbf2de873d0f4165ce0252bee689a.pdf; LCSC: C22374618; MANUFACTURER: Hanbo Electronic; MPN: TF-027-H375
JUART0 = microbuilder:HEADER-1X2: PIN HEADER
JUSB = adafruit_electromech:USB_C: USB Type-C USB 2.0 Connector; LCSC: C165948
L1 LBST = microbuilder:INDUCTOR: Inductors 0603: 10nH Ceramic Inductor - microwire antenna/RF (Digikey: 712-1434-2-ND) 0805: 560nH Ceramic Inductor - RF (Digikey: 553-1047-1-ND) 270nH Ceramic Inductor - Q = 40@250MHz, +-5%, 1 Ohm DC Resistance (Digikey: 535-10506-2-ND) 1007 (2518 Metric) SMT: 10µH 10% 250mOhm 820mA 1007 Inductor (Digikey: 587-2189-1-ND) 22µH 10% 500mOhm 580mA 1007 Inductor (Digikey: 587-2190-1-ND) 47µH 10% 950mOhm 420mA 1007 Inductor (Digikey: 587-2191-1-ND) 47µH 5% 100mOhm 1A 1008 Inductor (Digikey: 732-1816-1-ND) 5.0x5.0mm (Taiyo Yuden NR5040 Series) 6.8µH 20% 2.3A 64mOhm Inductor (Digikey: 587-2374-2-ND) 5.0x5.0mm (TDK VLC5045 Series) 4.7µH 20% 3.3A 34mOhm Inductor (Digikey: 445-6526-1-ND) 6.8µH 20% 2.7A 46mOhm Inductor (Digikey: 445-6527-1-ND) 6.0x6.0mm (TDK VLC6045 Series) 4.7µH 20% 3.8A 27mOhm Inductor (Digikey: 445-6538-2-ND) 6.8µH 20% 3A 41mOhm Inductor (Digikey: 445-6540-1-ND) 6.2µH 30% 2.2A 45mOhm Inductor (Digikey: SRR5028-6R2YCT-ND) - Not TDK VLC6045 but footprint should match 6.0x6.0mm (TDK SLF6045 Series) 6.8uH 30% 2A 33mOhm Inductor (Digikey: 445-4572-1-ND, Mouser: 810-SLF645T6R8N2R0PF) 6.0x6.0mm (Sumida CDRH5D28 Series) 6.2uH 30% 1.8A 45mOhm Inductor (Digikey: 308-1542-1-ND) Taiyo Yuden NR3015T2R2M - 2.2uH 20% 1.5A (Digikey: 587-1648-2-ND, Mouser: 963-NR3015T2R2M) - Used with TI TPS62172 CoilCraft RFID Transponder Coil - MA5532-AE (For use with AS3935 Lightning Sensor) Taiyo Yuden NRH2412T2R2MNGH - 2.2uH 20% 1AA (Digikey: 587-3443-1-ND) - Used with TI LM3671 Vishay IHLP 1.0uH Molded Inductor - 24mOhm DCR, 5A, +/-20%, -55°C-125°C (Digikey: 541-1319-1-ND)
L2 L3 = microbuilder:INDUCTOR: Inductors 0603: 10nH Ceramic Inductor - microwire antenna/RF (Digikey: 712-1434-2-ND) 0805: 560nH Ceramic Inductor - RF (Digikey: 553-1047-1-ND) 270nH Ceramic Inductor - Q = 40@250MHz, +-5%, 1 Ohm DC Resistance (Digikey: 535-10506-2-ND) 1007 (2518 Metric) SMT: 10µH 10% 250mOhm 820mA 1007 Inductor (Digikey: 587-2189-1-ND) 22µH 10% 500mOhm 580mA 1007 Inductor (Digikey: 587-2190-1-ND) 47µH 10% 950mOhm 420mA 1007 Inductor (Digikey: 587-2191-1-ND) 47µH 5% 100mOhm 1A 1008 Inductor (Digikey: 732-1816-1-ND) 5.0x5.0mm (Taiyo Yuden NR5040 Series) 6.8µH 20% 2.3A 64mOhm Inductor (Digikey: 587-2374-2-ND) 5.0x5.0mm (TDK VLC5045 Series) 4.7µH 20% 3.3A 34mOhm Inductor (Digikey: 445-6526-1-ND) 6.8µH 20% 2.7A 46mOhm Inductor (Digikey: 445-6527-1-ND) 6.0x6.0mm (TDK VLC6045 Series) 4.7µH 20% 3.8A 27mOhm Inductor (Digikey: 445-6538-2-ND) 6.8µH 20% 3A 41mOhm Inductor (Digikey: 445-6540-1-ND) 6.2µH 30% 2.2A 45mOhm Inductor (Digikey: SRR5028-6R2YCT-ND) - Not TDK VLC6045 but footprint should match 6.0x6.0mm (TDK SLF6045 Series) 6.8uH 30% 2A 33mOhm Inductor (Digikey: 445-4572-1-ND, Mouser: 810-SLF645T6R8N2R0PF) 6.0x6.0mm (Sumida CDRH5D28 Series) 6.2uH 30% 1.8A 45mOhm Inductor (Digikey: 308-1542-1-ND) Taiyo Yuden NR3015T2R2M - 2.2uH 20% 1.5A (Digikey: 587-1648-2-ND, Mouser: 963-NR3015T2R2M) - Used with TI TPS62172 CoilCraft RFID Transponder Coil - MA5532-AE (For use with AS3935 Lightning Sensor) Taiyo Yuden NRH2412T2R2MNGH - 2.2uH 20% 1AA (Digikey: 587-3443-1-ND) - Used with TI LM3671 Vishay IHLP 1.0uH Molded Inductor - 24mOhm DCR, 5A, +/-20%, -55°C-125°C (Digikey: 541-1319-1-ND); DATASHEET: https://www.sunlordinc.com/uploads/files/20230303/MWSA-S%C2%A0series%C2%A0of%C2%A0SMD%C2%A0Power%C2%A0Inductor.pdf; DCR_MAX: 58mOhm; IRMS: 3.8A at 20C rise, 20C ambient; IRMS_TYP: 4.5A at 40C rise, 20C ambient; ISAT: 4.0A at approximately 20% inductance drop; ISAT_TYP: 5.0A at approximately 30% inductance drop; LCSC: C408335; MANUFACTURER: Sunlord; MPN: MWSA0402S-2R2MT
LED1 = microbuilder:WS2812B; ROT: 180
QBAT = microbuilder:MOSFET-P: P-Channel Mosfet LEGEND VDS: Voltage Drain-Source ID: Drain Current RDS(ON): Drain-Source On-State Resistance VGS(TH): Gate-Source Threshold Voltage CISS: Drain-Source Input Capacitance SOT-23 Name VDS ID RDS(ON) VGS(TH) CISS Order Number IRLML5103 30V 760mA 600 mOhm -- 75pF @ 25V Digikey: IRLML5103PBFCT-ND IRLML6401 12V 4.3A 50 mOhm 950mV @ 250µA 830pF @ 10V Digikey: IRLML6401PBFTR-ND NTR0202PL 20V 400mA 800 mOhm 2.3V @ 250uA 70pF @ 5V Digikey: NTR0202PLT1GOSTR-ND NTR4101PT1G 20V 1.8A 85 mOhm 1.2V @ 250uA 675pF @ 10V Digikey: NTR4101PT1GOSCT-ND DMP2004K 20V 600mA 900 mOhm 1V @ 250uA 175pF @ 16V Digikey: DMP2004KDICT-ND PMV65XP 20V 3.9A 76 mOhm 950mV @ 1mA 725pF @ 20V Digikey: 568-2358-2-ND TO-252 Name VDS ID RDS(ON) VGS(TH) CISS Order Number AOD417 30V 25A 34 mOhm 3V @ 250µA 920pF @ 15V Digikey: 785-1106-2-ND PowerPak Name VDS ID RDS(ON) VGS(TH) CISS Order Number AON7401 30V 12A 14 mOhm 3V @ 250µA 2600pF @ 15V Digikey: 785-1302-1-ND; MANUFACTURER: Diodes Incorporated; MPN: DMP2045U-7
R1-R10 R15 R22-R24 R31-R44 R50-R54 RBATG RBBOT RBSTBOT RBSTTOP RBTOP RCHG RDONE REN RHSLIM RON RPROG RSD0 RSD1-RSD3 RSDCD RSDCMD RUSER = microbuilder:RESISTOR: Resistors For new designs, use the packages preceded by an '_' character since they are more reliable: The following footprints should be used on most boards: _0402 - Standard footprint for regular board layouts _0603 - Standard footprint for regular board layouts _0805 - Standard footprint for regular board layouts _1206 - Standard footprint for regular board layouts For extremely tight-pitch boards where space is at a premium, the following 'micro-pitch' footprints can be used (smaller pads, no silkscreen outline, etc.): _0402MP - Micro-pitch footprint for very dense/compact boards _0603MP - Micro-pitch footprint for very dense/compact boards _0805MP - Micro-pitch footprint for very dense/compact boards _1206MP - Micro-pitch footprint for very dense/compact boards
SWBOOT = adafruit_electromech:SWITCH_TACT_SMT: SMT Tact Switches RKB2 https://www.digikey.com/short/m027prz5; LCSC: C843674; MANUFACTURER: G-Switch; MPN: GT-TC048D-H025-L1
SWPWR = adafruit_electromech:SWITCH_SPDT: Switch - SPDT SSSS811101 - Horizontal Two Position SMT, 0.3A 4V [Mouser: 688-SSSS811101]
SWRESET = adafruit_electromech:SWITCH_SPST_MNT: Switch - SPST 4UCon 19192 (6.7x2.6mm SMT); LCSC: C778159
U1 = adafruit_wireless:ESP32-P4: Espressif ESP32-P4 high-performance application SoC Dual-core 400 MHz HP RISC-V plus LP core, MIPI CSI/DSI, USB 2.0 HS/FS, Ethernet MAC, H.264/JPEG acceleration, and in-package 1.8 V PSRAM. This library entry targets current v3.2-or-later X-series silicon; package pin 54 is VDD_HP_1. Symbol and pin map: ESP32-P4 Series Datasheet v0.7. Symbol pins XTALP and XTALN correspond to datasheet signals XTAL_P and XTAL_N; the aliases avoid EAGLE interpreting an underscore-N suffix as active-low notation. Footprint geometry cross-checked against Espressif kicad-libraries revision dd76561812ab300351234ba6e0ec1295641796f0 (CC-BY-SA-4.0 with design-output exception).; DATASHEET: https://www.espressif.com/sites/default/files/documentation/esp32-p4_datasheet_en.pdf; FOOTPRINT_SOURCE: https://github.com/espressif/kicad-libraries/tree/dd76561812ab300351234ba6e0ec1295641796f0; LCSC: C9900140808; MANUFACTURER: Espressif Systems; MPN: ESP32-P4NRW32X; PSRAM: 32MB in-package; SILICON: v3.2 or later; marking XHXX
U2 = microbuilder:SPIFLASH_8PIN: SOIC8 SPI Flash Be careful with the size since SOIC8 flash comes in several 'widths' SOIC8 150 mil M25P16 - 16Mbit (2Mbit x 8) Serial Flash (75MHz SPI Bus), Supply: 2.7-3.6V Digikey: SOIC8 - M25P16-VMN6P-ND SOIC8 208 mil W25Q16BVSSIG - 16Mbit (2Mbit x 8) Serial Flash (104MHz SPI Bus), Supply: 2.7-3.6V Digikey: SOIC8 - W25Q16BVSSIG-ND; CAPACITY: 16MB; MPN: GD25Q128ESIG; PACKAGE_VERIFIED: S = SOP8 208mil, GigaDevice datasheet rev1.4
U3 = adafruit_power:TPS563201: TI TPS563201, 3A synchronous buck; SLVSD90B Rev B. Pin map and SOT23-6 reused from TPS54302 after datasheet comparison: 1 GND, 2 SW, 3 VIN, 4 FB, 5 EN, 6 VBST (symbol alias BOOT).; DATASHEET: https://www.ti.com/lit/ds/symlink/tps563201.pdf; MPN: TPS563201DDCR
U4 U5 = adafruit_power:VREG_BUCK_5PIN; DATASHEET: https://www.ti.com/lit/ds/symlink/tlv62569.pdf; MPN: TLV62569DBVR
U6 = adafruit_wireless:ESP32-C6-MINI; HOST_INTERFACE: SDIO per P4X eval Rev1.7; MPN: ESP32-C6-MINI-1-N4
U10 = microbuilder:ESDDIODEARRAY_USBLC6-2SC6: STMicroelectronics USBLC6-2SC6 rail-to-rail, two-line low-capacitance ESD protection array for USB 2.0 high-speed data pairs. JLCPCB/LCSC part: C7519. Reuses the established PRTR5V0U2X ESD-array symbol already used in Adafruit schematics. Each duplicated same-name I/O pair is grouped into one EAGLE schematic pin: IO1 maps to pads 1 and 6; IO2 maps to pads 3 and 4. VCC is the protected VBUS reference rail. Package and pin mapping follow STMicroelectronics DS4260 Rev. 7.; DATASHEET: https://www.st.com/resource/en/datasheet/usblc6-2.pdf; LCSC: C7519; MANUFACTURER: STMicroelectronics; MPN: USBLC6-2SC6
UBAT = microbuilder:MCP73831/2: MCP73831/2 LIPO Charger VDD: 3.75 - 6V Temp -40 - 85°C Programmable Charge Rate: 15-500mA NOTE: STAT is a tri-state logic output on the MCP73831 and an open-drain output on the MCP73832. SOT23-5 with 4.2V output and tri-state logic on STAT = MCP73831T-2ACI/OT; JLC_ROTATION: 0; LCSC: C424093
UBST = adafruit_power:TPS61023; LCSC: C919459; MPN: TPS61023DRLR; ROT: 180
UHSW = adafruit_power:AP22653: Diodes Incorporated AP22653W6-7 active-high, 2.1 A single-channel USB power-distribution switch with programmable current limit, reverse-current blocking, soft start, and active-low open-drain fault reporting. JLCPCB/LCSC part: C2158037. Package and pin mapping follow Diodes Incorporated DS41186 Rev. 5-2 (March 2026).; DATASHEET: https://www.diodes.com/datasheet/download/AP22652_AP22653_AP22652A_AP22653A.pdf; LCSC: C2158037; MANUFACTURER: Diodes Incorporated; MPN: AP22653W6-7
Y1 = microbuilder:CRYSTAL_GND: Shielded SMD Crystal (case to GND) 4-pad SMD crystal where the case/shield pads are bonded to GND for EMI suppression and mechanical anchoring. Use this variant in place of the standard 2-pin CRYSTAL when you want the can grounded. Add more package sizes as new SMDxxxx-4P footprints are added to the library. 2.0 x 1.6mm - SMD2016-4P 4-pad ceramic package Smallest commonly stocked low-cost size; ≥24 MHz only (low-frequency parts won't fit). E.g. 24/26 MHz 8-9pF. 2.5 x 2.0mm - SMD2520-4P 4-pad ceramic package Common compact size; ≥16 MHz typical. E.g. 16/24/26 MHz 8-12pF. 3.2 x 2.5mm - SMD3225-4P 4-pad ceramic package General-purpose; supports 8 MHz and up. E.g. YXC X32258MOB4SI 8MHz/12pF, LCSC C9002 family.; DATASHEET: https://ecsxtal.com/store/pdf/ecx-1637b.pdf; LOAD_CAPACITANCE: 10pF; MPN: ECS-400-10-37B-CKY-TR3

## Net classes
0 SIGNAL: width 0.152 mm, drill 0.203 mm, clearance 0.152 mm
1 POWER: width 0.61 mm, drill 0.33 mm, clearance 0.152 mm
2 HIGHPOWER: width 1.016 mm, drill 0.381 mm, clearance 0.152 mm
3 FINEPOWER: width 0.191 mm, drill 0.33 mm, clearance 0.152 mm
4 LOCALPOWER: width 0.305 mm, drill 0.33 mm, clearance 0.152 mm
5 GROUND: width 0.203 mm, drill 0.33 mm, clearance 0.152 mm
6 SWITCH: width 0.61 mm, drill 0.483 mm, clearance 0.152 mm